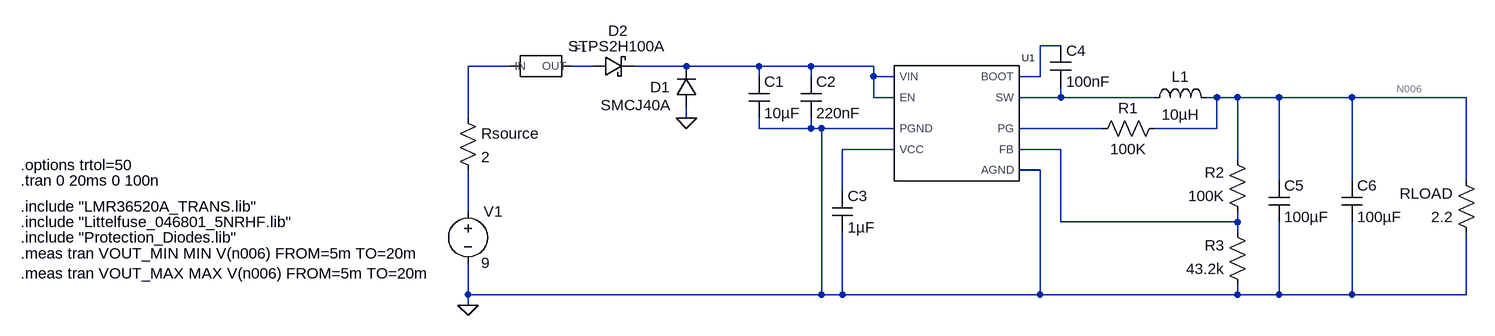
[diagram p0: schematic Power_Supply.asc]
Power_Supply.asc, the LTspice schematic file:
Version 4.1
SHEET 1 1252 680
WIRE 560 -16 528 -16
WIRE -288 16 -352 16
WIRE -160 16 -192 16
WIRE -16 16 -96 16
WIRE 96 16 -16 16
WIRE 176 16 96 16
WIRE 272 16 176 16
WIRE 96 32 96 16
WIRE 176 32 176 16
WIRE 272 32 272 16
WIRE 304 32 272 32
WIRE 528 32 528 -16
WIRE 528 32 496 32
WIRE 272 64 272 32
WIRE 304 64 272 64
WIRE 560 64 560 48
WIRE 560 64 496 64
WIRE 704 64 560 64
WIRE 800 64 784 64
WIRE 832 64 800 64
WIRE 896 64 832 64
WIRE 1008 64 896 64
WIRE 1184 64 1008 64
WIRE -352 96 -352 16
WIRE -16 96 -16 80
WIRE 96 112 96 96
WIRE 176 112 176 96
WIRE 176 112 96 112
WIRE 192 112 176 112
WIRE 304 112 192 112
WIRE 624 112 496 112
WIRE 800 112 800 64
WIRE 800 112 704 112
WIRE 304 144 224 144
WIRE 560 144 496 144
WIRE 832 160 832 64
WIRE 528 176 496 176
WIRE 896 192 896 64
WIRE 1008 192 1008 64
WIRE 1184 192 1184 64
WIRE 224 208 224 144
WIRE -352 240 -352 176
WIRE 560 256 560 144
WIRE 832 256 832 240
WIRE 832 256 560 256
WIRE 832 272 832 256
WIRE -352 368 -352 320
WIRE 192 368 192 112
WIRE 192 368 -352 368
WIRE 224 368 224 272
WIRE 224 368 192 368
WIRE 528 368 528 176
WIRE 528 368 224 368
WIRE 832 368 832 352
WIRE 832 368 528 368
WIRE 896 368 896 256
WIRE 896 368 832 368
WIRE 1008 368 1008 256
WIRE 1008 368 896 368
WIRE 1184 368 1184 272
WIRE 1184 368 1008 368
WIRE -352 384 -352 368
FLAG -352 384 0
FLAG -16 96 0
SYMBOL Littelfuse_046801_5NRHF -288 16 R0
SYMATTR InstName F1
SYMBOL diode 0 80 R180
WINDOW 0 41 32 Left 2
WINDOW 3 40 4 Left 2
SYMATTR InstName D1
SYMATTR Value SMCJ40A
SYMBOL schottky -160 32 R270
WINDOW 0 86 39 VBottom 2
WINDOW 3 31 37 VTop 2
SYMATTR InstName D2
SYMATTR Value STPS2H100A
SYMBOL voltage -352 224 R0
WINDOW 123 0 0 Left 0
WINDOW 39 20 123 Left 2
WINDOW 3 20 95 Left 2
SYMATTR Value 9
SYMATTR InstName V1
SYMBOL res -368 80 R0
SYMATTR InstName Rsource
SYMATTR Value 2
SYMATTR SpiceLine tol=5 pwr=5W
SYMBOL LMR36520A_TRANS 400 96 R0
SYMATTR InstName U1
SYMBOL cap 208 208 R0
SYMATTR InstName C3
SYMATTR Value 1µF
SYMATTR SpiceLine V=16V Rser=0.05 Rpar=100MEG Cpar=0
SYMBOL cap 80 32 R0
SYMATTR InstName C1
SYMATTR Value 10µF
SYMATTR SpiceLine V=100V Rser=0.02 Rpar=100MEG Cpar=0
SYMBOL cap 160 32 R0
SYMATTR InstName C2
SYMATTR Value 220nF
SYMATTR SpiceLine V=100V Rser=0.05 Rpar=100MEG Cpar=0
SYMBOL cap 544 -16 R0
SYMATTR InstName C4
SYMATTR Value 100nF
SYMATTR SpiceLine V=16V Rser=0.05 Rpar=100MEG Cpar=0
SYMBOL cap 880 192 R0
SYMATTR InstName C5
SYMATTR Value 100µF
SYMATTR SpiceLine V=6.3V Rser=0.02 Rpar=100MEG Cpar=0
SYMBOL cap 992 192 R0
SYMATTR InstName C6
SYMATTR Value 100µF
SYMATTR SpiceLine V=6.3V Rser=0.02 Rpar=100MEG Cpar=0
SYMBOL ind 688 80 R270
WINDOW 0 32 56 VTop 2
WINDOW 3 5 56 VBottom 2
SYMATTR InstName L1
SYMATTR Value 10µH
SYMATTR SpiceLine Ipk=10 Rser=0.033 Rpar=1G Cpar=0
SYMBOL res 720 96 R90
WINDOW 0 0 56 VBottom 2
WINDOW 3 32 56 VTop 2
SYMATTR InstName R1
SYMATTR Value 100K
SYMATTR SpiceLine tol=1 pwr=63mW
SYMBOL res 848 256 R180
WINDOW 0 36 76 Left 2
WINDOW 3 36 40 Left 2
SYMATTR InstName R2
SYMATTR Value 100K
SYMATTR SpiceLine tol=1 pwr=63mW
SYMBOL res 848 368 R180
WINDOW 0 36 76 Left 2
WINDOW 3 36 40 Left 2
SYMATTR InstName R3
SYMATTR Value 43.2k
SYMATTR SpiceLine tol=1 pwr=62.5mW
SYMBOL res 1200 288 R180
WINDOW 0 36 76 Left 2
WINDOW 3 36 40 Left 2
SYMATTR InstName RLOAD
SYMATTR Value 2.2
SYMATTR SpiceLine tol=1 pwr=10
TEXT -1040 232 Left 2 !.include "LMR36520A_TRANS.lib"
TEXT -1040 192 Left 2 !.tran 0 20ms 0 100n
TEXT -1040 256 Left 2 !.include "Littelfuse_046801_5NRHF.lib"
TEXT -1040 280 Left 2 !.include "Protection_Diodes.lib"
TEXT -1040 168 Left 2 !.options trtol=50
TEXT -1040 304 Left 2 !.meas tran VOUT_MIN MIN V(n006) FROM=5m TO=20m\n.meas tran VOUT_MAX MAX V(n006) FROM=5m TO=20m

The netlist it stands for:
* Power_Supply.asc
X§F1 N002 N003 Littelfuse_046801_5NRHF  ; pins IN OUT
D1 0 N004 SMCJ40A
D2 N003 N004 STPS2H100A
V1 N010 0 9
Rsource N002 N010 2 tol=5 pwr=5W
X§U1 0 N001 N004 N009 N007 0 N005 N008 N004 LMR36520A_TRANS  ; pins AGND BOOT EN FB PG PGND SW VCC VIN
C3 N008 0 1µF V=16V Rser=0.05 Rpar=100MEG Cpar=0
C1 N004 0 10µF V=100V Rser=0.02 Rpar=100MEG Cpar=0
C2 N004 0 220nF V=100V Rser=0.05 Rpar=100MEG Cpar=0
C4 N001 N005 100nF V=16V Rser=0.05 Rpar=100MEG Cpar=0
C5 N006 0 100µF V=6.3V Rser=0.02 Rpar=100MEG Cpar=0
C6 N006 0 100µF V=6.3V Rser=0.02 Rpar=100MEG Cpar=0
L1 N005 N006 10µH Ipk=10 Rser=0.033 Rpar=1G Cpar=0
R1 N006 N007 100K tol=1 pwr=63mW
R2 N009 N006 100K tol=1 pwr=63mW
R3 0 N009 43.2k tol=1 pwr=62.5mW
RLOAD 0 N006 2.2 tol=1 pwr=10
.model D D
.lib standard.dio
.include "LMR36520A_TRANS.lib"
.tran 0 20ms 0 100n
.include "Littelfuse_046801_5NRHF.lib"
.include "Protection_Diodes.lib"
.options trtol=50
.meas tran VOUT_MIN MIN V(n006) FROM=5m TO=20m
.meas tran VOUT_MAX MAX V(n006) FROM=5m TO=20m
.backanno
.end